# Altium project BA_Leo_Maier_DiffProbes.PrjPcb
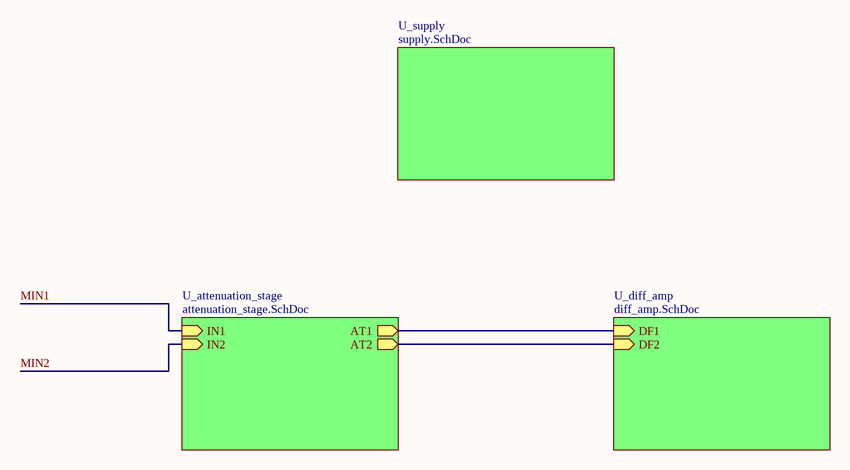
[diagram p0: diff_probe.SchDoc]
4 sheets, 60 parts. Net scope: hierarchical (ports join the sheet entries above them; power ports are global).
Board files: diff_probe_v2.PcbDoc, diff_probe.PcbDoc
Sheets:
  diff_probe.SchDoc
    U_diff_amp = diff_amp.SchDoc
    U_supply = supply.SchDoc
    U_attenuation_stage = attenuation_stage.SchDoc

## Sheet diff_probe.SchDoc
size A4; CompanyName: MCI Management Center Innsbruck; Address1: Universitätsstraße 15; Address2: A-6020 Innsbruck

### Sub-sheets
U_attenuation_stage = attenuation_stage.SchDoc: AT1 (out), AT2 (out), IN1 (in), IN2 (in)
U_diff_amp = diff_amp.SchDoc: DF1 (in), DF2 (in)
U_supply = supply.SchDoc: no entries

### Nets
NetR21_1: sheet U_diff_amp/DF1, sheet U_attenuation_stage/AT1
NetR23_1: sheet U_diff_amp/DF2, sheet U_attenuation_stage/AT2

### Notes on the sheet
- Size:
- Mechatronics - Electrical Engineering
- Project:
- A4
- Title:
- Date:
- Revision:
- Sheet:
- of
- File:
- Author:

## Sheet diff_amp.SchDoc
size A4; CompanyName: MCI Management Center Innsbruck; Address1: Universitätsstraße 15; Address2: A-6020 Innsbruck
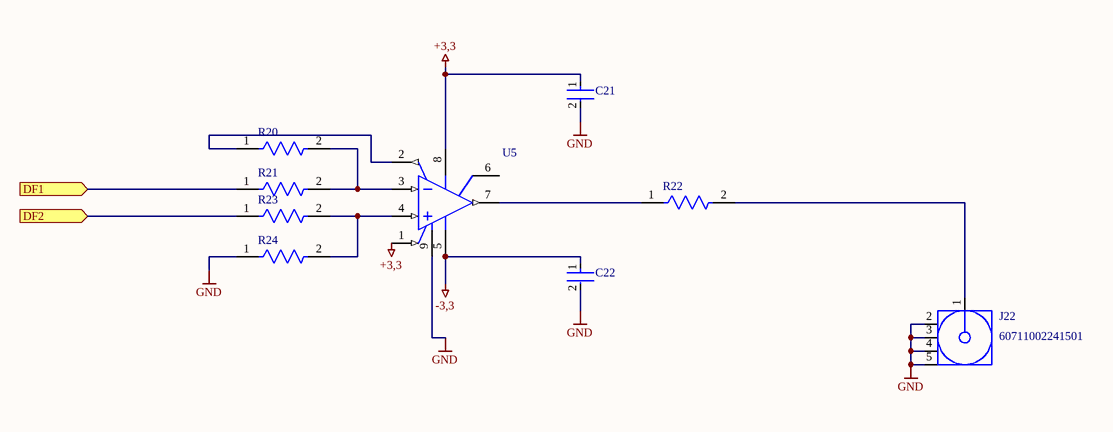
[diagram p1: diff_amp.SchDoc]

### Parts
C21  CGA2B3X7R1E104K050BB  [FP-CGA2B-IPC_B]  (value not drawn)
C22  CGA2B3X7R1E104K050BB  [FP-CGA2B-IPC_B]  (value not drawn)
J22  60711002241501  [60711002241501]
R20  RG1005N-4020-W-T5  [FP-RG1005-IPC_B]  (value not drawn)
R21  RG1005N-4020-W-T5  [FP-RG1005-IPC_B]  (value not drawn)
R22  RT0603BRE0749R9L  [FP-RT0603-MFG]  (value not drawn)
R23  RG1005N-4020-W-T5  [FP-RG1005-IPC_B]  (value not drawn)
R24  RG1005N-4020-W-T5  [FP-RG1005-IPC_B]  (value not drawn)
U5  ADA4817-1ACPZ-R7  [ADI-CP-8-2_L]  (value not drawn)

### Ports
DF1 (in), DF2 (in)

### Nets
+3,3: C21.1 U5.1(~{PD}) U5.8(+VS)
-3,3: C22.1 U5.5(-VS)
GND: C21.2 C22.2 J22.2(GND) J22.3(GND) J22.4(GND) J22.5(GND) R24.1 U5.9(EP)
NetJ22_1: J22.1(Signal) R22.2
NetR20_1: R20.1 U5.2(FB)
NetR20_2: R20.2 R21.2 U5.3(-IN)
NetR21_1: R21.1 ; port DF1
NetR22_1: R22.1 U5.7(OUT)
NetR23_1: R23.1 ; port DF2
NetR23_2: R23.2 R24.2 U5.4(+IN)

Not connected (* = marked no-connect by the designer): U5 6(NC)

### Notes on the sheet
- Size:
- Mechatronics - Electrical Engineering
- Project:
- A4
- Title:
- Date:
- Revision:
- Sheet:
- of
- File:
- Author:

### Library data of the parts
C21 C22 = CMP-2000-06086-2: Cap Ceramic 100nF 25V X7R 10% Pad SMD 0402 +125°C Automotive T/R; Lead Free: Lead Free; Termination: SMD/SMT; Voltage Rating: 25V; Voltage: 25V; Composition: Ceramic; Case/Package: 0402; Mount: Surface Mount; Voltage Rating (DC): 25V; Tolerance: 10%; Length: 1mm; Width: 0.02inch; REACH SVHC: No SVHC; Max Operating Temperature: 125°C; Case Code (Metric): 1005; Case Code (Imperial): 0402; Package Quantity: 1; Depth: 0.5mm; Min Operating Temperature: -55°C; Thickness: 0.022inch; Capacitance: 100nF; Height: 0.5mm; Dielectric: X7R; Packaging: Tape and Reel; Weight: 2.3E-05oz; Ratings: AEC-Q200
J22 = CMP-03913-154947495-1: Rf Coax Conn, Smc R/a Jack, 50 Ohm, Pcb Rohs Compliant: Yes
R20 R21 R23 R24 = CMP-28537-013757-1: Automotive Metal Thin Film Chip Resistor, 0402, 402Ω, 0.05%, 10ppm/°C, 0.0625W, 75V; Voltage Rating (DC): 25V; Resistance: 402R; Power Rating: 30mW; Max Power Dissipation: 63mW; Package Quantity: 5000; Case/Package: 0402; Max Operating Temperature: 155°C; Case Code (Imperial): 0402; Height: 0.016inch; Voltage Rating: 25V; Min Operating Temperature: -55°C; Temperature Coefficient: 10ppm/°C; Length: 0.039inch; Features: Automotive AEC-Q200; Width: 0.5mm; Series: RG; RoHS Compliant: Yes; Resistor Type: Thin Film; Packaging: Tape and Reel; Tolerance: 0.05%; Lead Free: Lead Free; Case Code (Metric): 1005; Number of Terminations: 2; Termination: SMD/SMT
R22 = CMP-2000-04544-2: RES SMD 49.9 OHM 0.1% 1/10W 0603; Manufacturer: Yageo; Temperature Coefficient: 50 ppm/°C; Tolerance: 0.001; Voltage Rating: 75V; Power Rating: 0.1W; Resistance: 49.9Ω; Value: 49.9Ω; ComponentLink2URL: http://www.yageo.com/documents/recent/PYu-RT_1-to-0.01_RoHS_L_9.pdf; Composition: Thin Film; Category: Res; Manufacturer Part Number: RT0603BRE0749R9L; Digikey Description: RES SMD 49.9 OHM 0.1% 1/10W 0603; RoHS: TRUE; Temperature Range Low: -55°C; Device Class L3: Chip SMD Resistors; Package: RT0603; Automotive: No; Temperature Range High: +155°C; Height: 0.55mm; Device Class L2: Resistors; Mouser Description: RT Series 0603 0.1 W 49.9 kOhm ±0.1 % ±50 ppm/°C SMT Thin Film Chip Resistor; Lead Free: Yes; Series: RT; Octopart: https://octopart.com/rt0603bre0749r9l-yageo-1456229; ComponentLink2Description: Datasheet; Footprint Url: http://www.yageo.com/exep/pages/download/literatures/PYu-R_Mount_10.pdf; Device Class L1: Passive Components; Temperature: -55°C to +155°C; Ipc Land Pattern Name: RESC16080X45
U5 = CMP-0384-00096-1: Single Channel Low Noise Operational Amplifier, 1.05 GHz BW, 870 V/us SR, Industrial, 8-pin QFN (CP-8-2), Reel; Manufacturer: Analog Devices; Iq/Amp: 21mA; Input Bias Current: 2pA; Amplifiers Per Package: 1; V Span Max: 10V; Input Offset Voltage: 2mV; V Span Min: 5V; DatasheetVersion: Rev. A; ComponentLink2URL: http://www.analog.com/static/imported-files/data_sheets/ADA4817-1_4817-2.pdf; ComponentLink1Description: Manufacturer URL; ComponentLink1URL: http://www.analog.com/en/index.html; PartNumber: ADA4817-1ACPZ-R7; PackageVersion: 061507-B; ComponentLink3URL: http://www.analog.com/static/imported-files/packages/56953322593982CP_8_2.pdf; Slew Rate: 870V/us; ComponentLink2Description: Datasheet; Generic Part Number: ADA4817-1; PackageReference: CP-8-2; Small Signal Bandwidth: 1.05GHz; Mounting Technology: Surface Mount; ComponentLink3Description: Package Specification; PackageDescription: 8-Pin Lead Frame Chip Scale Package, Body 3 x 3 mm, Pitch 0.5 mm

## Sheet supply.SchDoc
size A4; CompanyName: MCI Management Center Innsbruck; Address1: Universitätsstraße 15; Address2: A-6020 Innsbruck
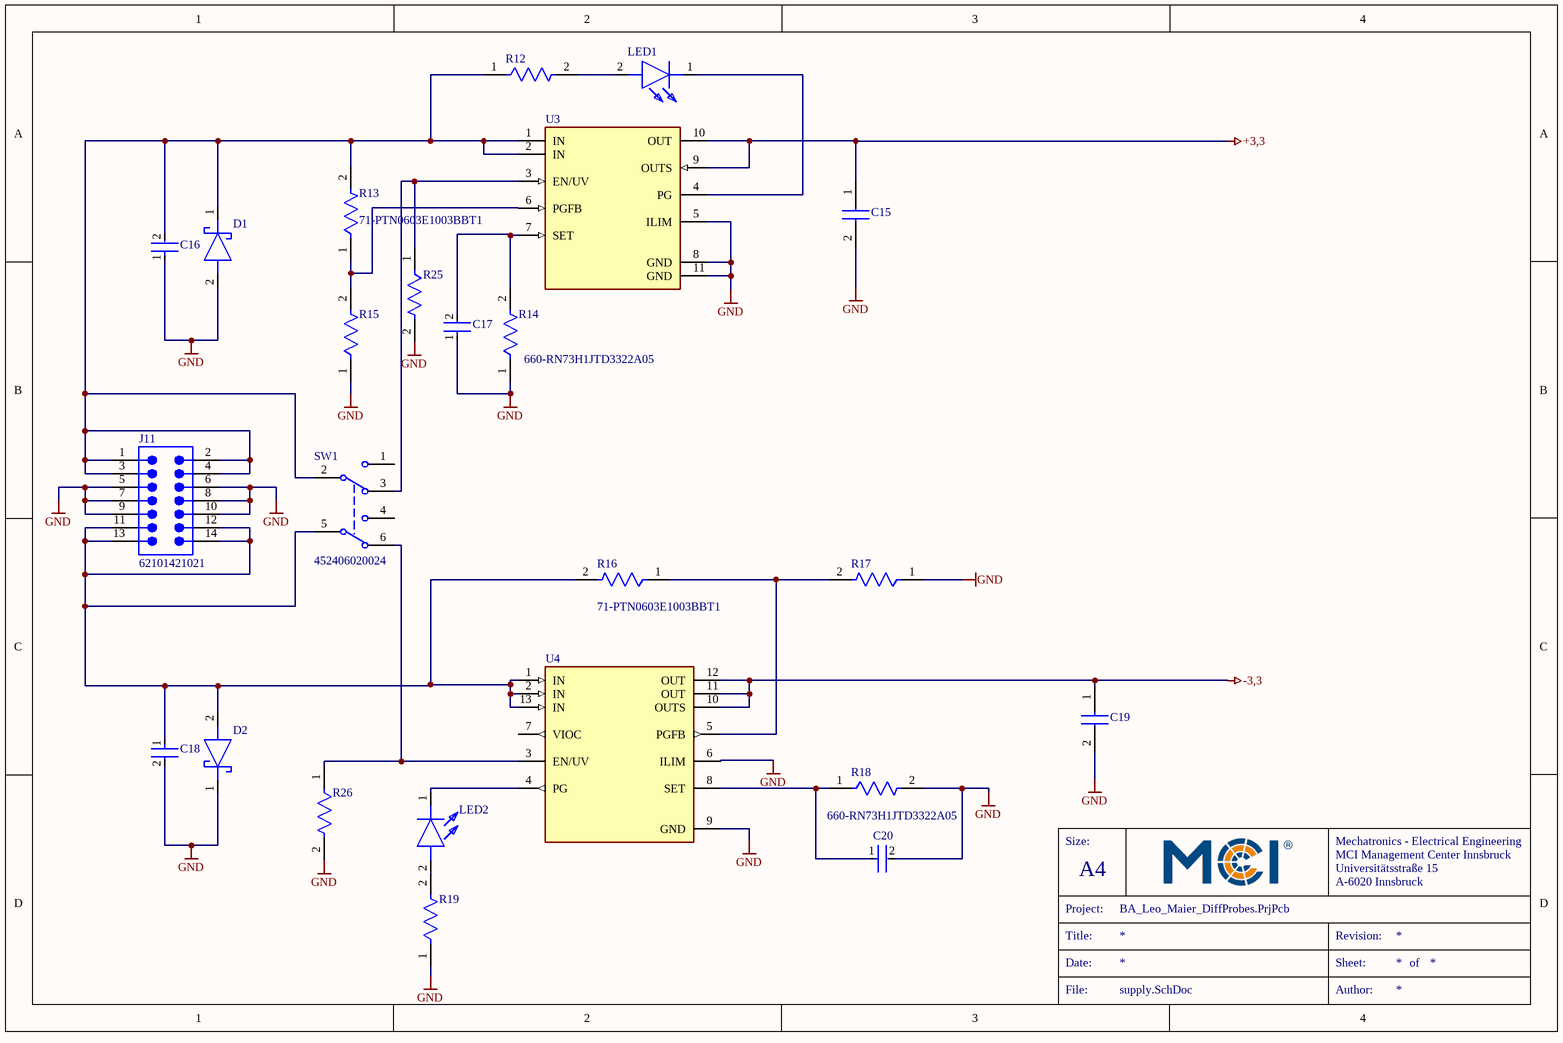
[diagram p2: supply.SchDoc]

### Parts
C15  MCASE31LBB7226MTNA01  [CAPC3214X190N]  (value not drawn)
C16  CGA4J1X7R1E475K125AE  [FP-CGA4J-IPC_A]  (value not drawn)
C17  CGA4J1X7R1E475K125AE  [FP-CGA4J-IPC_A]  (value not drawn)
C18  CGA4J1X7R1E475K125AE  [FP-CGA4J-IPC_A]  (value not drawn)
C19  MCASE31LBB7226MTNA01  [CAPC3214X190N]  (value not drawn)
C20  CGA4J1X7R1E475K125AE  [FP-CGA4J-IPC_A]  (value not drawn)
D1  RB521S-30  [SODFL1608X77N]  (value not drawn)
D2  RB521S-30  [SODFL1608X77N]  (value not drawn)
J11  62101421021  [62101421021]
LED1  APT1608SEC_J3-AMT  [APT1608SECJ3AMT]  (value not drawn)
LED2  APT1608SEC_J3-AMT  [APT1608SECJ3AMT]  (value not drawn)
R12  AC0402FR-7W1K2L  [FP-AC0402-IPC_A]  (value not drawn)
R13  Mouser Part Number: 71-PTN0603E1003BBT1  [FP-RT0603-MFG]  (hidden comment: RT0603BRE07100KL)
R14  Mouser Part Number: 660-RN73H1JTD3322A05  [FP-AT0603-IPC_B]  (hidden comment: AT0603FRE0733K2L)
R15  RT0603BRD1310KL  [FP-RT0603-MFG]  (value not drawn)
R16  Mouser Part Number: 71-PTN0603E1003BBT1  [FP-RT0603-MFG]  (hidden comment: RT0603BRE07100KL)
R17  RT0603BRD1310KL  [FP-RT0603-MFG]  (value not drawn)
R18  Mouser Part Number: 660-RN73H1JTD3322A05  [FP-AT0603-IPC_B]  (hidden comment: AT0603FRE0733K2L)
R19  AC0402FR-7W1K2L  [FP-AC0402-IPC_A]  (value not drawn)
R25  RT0603BRE07100KL  [FP-RT0603-MFG]  (value not drawn)
R26  RT0603BRE07100KL  [FP-RT0603-MFG]  (value not drawn)
SW1  452406020024  [452406020024]
U3  LT3045EDD#PBF  [FP-LT3045EDD#PBF-MFG]  (value not drawn)
U4  LT3094EDD#PBF  [FP-DD-12-05-08-1725-IPC_B]  (value not drawn)

### Nets
+3,3: C15.1 U3.9(OUTS) U3.10(OUT)
-3,3: C19.1 U4.10(OUTS) U4.11(OUT) U4.12(OUT)
GND: C15.2 C16.1 C17.1 C18.2 C19.2 C20.2 D1.2(A) D2.1(K) J11.5 J11.6 J11.7 J11.8 J11.9 J11.10 R14.1 R15.1 R17.1 R18.2 R19.1 R25.2 R26.2 U3.5(ILIM) U3.8(GND) U3.11(GND) U4.6(ILIM) U4.9(GND)
NetC16_2: C16.2 D1.1(K) J11.1 J11.2 J11.3 J11.4 R12.1 R13.2 SW1.2(COM) U3.1(IN) U3.2(IN)
NetC17_2: C17.2 R14.2 U3.7(SET)
NetC18_1: C18.1 D2.2(A) J11.11 J11.12 J11.13 J11.14 R16.2 SW1.5(COM) U4.1(IN) U4.2(IN) U4.13(IN)
NetC20_1: C20.1 R18.1 U4.8(SET)
NetLED1_1: LED1.1(K) U3.4(PG)
NetLED1_2: LED1.2(A) R12.2
NetLED2_1: LED2.1(K) U4.4(PG)
NetLED2_2: LED2.2(A) R19.2
NetR13_1: R13.1 R15.2 U3.6(PGFB)
NetR16_1: R16.1 R17.2 U4.5(PGFB)
NetR25_1: R25.1 SW1.3 U3.3(EN/UV)
NetR26_1: R26.1 SW1.6 U4.3(EN/UV)

Not connected (* = marked no-connect by the designer): SW1 1 4; U4 7(VIOC)

### Notes on the sheet
- Size:
- Mechatronics - Electrical Engineering
- Project:
- A4
- Title:
- Date:
- Revision:
- Sheet:
- of
- File:
- Author:

### Library data of the parts
C15 C19 = MCASE31LBB7226MTNA01: Capacitor; Manufacturer_Name: TAIYO YUDEN; Datasheet Link: https://www.mouser.in/datasheet/3/940/1/c_mlcc_C_e.pdf; Height: 1.9mm; Manufacturer_Part_Number: MCASE31LBB7226MTNA01
C16-C18 C20 = CMP-08246-002248-1: Cap Ceramic 4.7uF 25V X7R 10% Pad SMD 0805 +125°C Automotive T/R; Thickness: 0.059inch; Length: 0.079inch; Voltage Rating: 25V; Case Code (Metric): 2012; Min Operating Temperature: -55°C; Capacitance: 4.7uF; Mount: Surface Mount; Ratings: AEC-Q200; Packaging: Tape and Reel; Features: Soft Termination; Width: 0.047inch; Max Operating Temperature: 125°C; Tolerance: 10%; Case/Package: 0805; Case Code (Imperial): 0805
  C16: Parameter 1: *
D1 D2 = RB521S-30: Schottky Diode; Manufacturer_Name: Comchip Technology; Datasheet Link: https://www.mouser.in/datasheet/3/819/1/RB521S_30_RevC543202.pdf; Height: 0.77mm; Manufacturer_Part_Number: RB521S-30; Mouser Part Number: 750-RB521S-30; Mouser Price/Stock: https://www.mouser.co.uk/ProductDetail/Comchip-Technology/RB521S-30?qs=2qJf6qQ4IOKtVSsHa5L7cw%3D%3D
J11 = CMP-1502-00928-4: Conn, Header, 14Pos, 2Row, 1.27Mm Rohs Compliant: Yes; Contact Resistance: 20mΩ; Gender: Male; Current Rating: 1A; Operating Supply Voltage: 100V; Orientation: Vertical; RoHS: Non-Compliant; Lead Pitch: 1.27mm; Number of Pins: 14
LED1 LED2 = APT1608SEC_J3-AMT: LED; Manufacturer_Name: Kingbright; Manufacturer_Part_Number: APT1608SEC/J3-AMT; Datasheet Link: https://www.kingbrightusa.com/images/catalog/SPEC/APT1608SEC-J3-AMT.pdf; Height: 0.85mm; Mouser Part Number: 604-APT1608SEC/J3AMT; Mouser Price/Stock: https://www.mouser.co.uk/ProductDetail/Kingbright/APT1608SEC-J3-AMT?qs=0pUdBCiL%2F4PrQrm2zkbL8w%3D%3D; Arrow Part Number: APT1608SEC/J3-AMT; Arrow Price/Stock: https://www.arrow.com/en/products/apt1608secj3-amt/kingbright?utm_currency=USD&region=nac
R12 R19 = CMP-03412-048489-1: RES 1.2kΩ ±1% 0.125W 0402
R13 R16 R25 R26 = CMP-2000-04515-2: RES SMD 100K OHM 0.1% 1/10W 0603; Manufacturer: Yageo; Tolerance: 0.001; Voltage Rating: 75V; Resistance: 100KΩ; Temperature Coefficient: 50 ppm/°C; Value: 100KΩ; Power Rating: 0.1W; Device Class L1: Passive Components; Category: Res; Ipc Land Pattern Name: RESC16080X45; Footprint Url: http://www.yageo.com/exep/pages/download/literatures/PYu-R_Mount_10.pdf; Temperature Range Low: -55°C; Package: RT0603; Automotive: No; ComponentLink2URL: http://www.yageo.com/documents/recent/PYu-RT_1-to-0.01_RoHS_L_9.pdf; Composition: Thin Film; Manufacturer Part Number: RT0603BRE07100KL; Temperature Range High: +155°C; Octopart: https://octopart.com/rt0603bre07100kl-yageo-1377021; RoHS: TRUE; Series: RT; ComponentLink2Description: Datasheet; Device Class L2: Resistors; Device Class L3: Chip SMD Resistors; Lead Free: Yes; Digikey Description: RES SMD 100K OHM 0.1% 1/10W 0603; Temperature: -55°C to +155°C; Height: 0.55mm
R14 R18 = CMP-03412-041587-1: Thin Film Chip Resistors Automotive Grade 33.2kΩ 1% 50ppm/°C 0603; RoHS Compliant: Yes
R15 R17 = CMP-03412-009757-1: RT0603 10KΩ 0.1W 25 ppm/°C 0.10%; Manufacturer: Yageo; Voltage Rating: 75V; Tolerance: 0.001; Resistance: 10KΩ; Manufacturer Part Number: RT0603BRD1310KL; Category: Res; Device Class L2: Resistors; Lead Free: Yes; Footprint Url: http://www.yageo.com/exep/pages/download/literatures/PYu-R_Mount_10.pdf; Ipc Land Pattern Name: RESC16080X45; Octopart: https://octopart.com/rt0603brd1310kl-yageo-30512336; Composition: Thin Film; Temperature Coefficient: 25 ppm/°C; ComponentLink2Description: Datasheet; Temperature Range Low: -55°C; Temperature Range High: +155°C; Value: 10KΩ; Device Class L1: Passive Components; Package: RT0603; Power Rating: 0.1W; Automotive: No; ComponentLink2URL: http://www.yageo.com/documents/recent/PYu-RT_1-to-0.01_RoHS_L_9.pdf; Mouser Description: Res Thin Film 0603 10K Ohm 0.1% 1/10W ±25ppm/°C Molded SMD Paper T/R; Device Class L3: Chip SMD Resistors; Temperature: -55°C to +155°C; Height: 0.55mm; RoHS: TRUE; Series: RT
SW1 = CMP-03913-146831046-2: WS-SLSV Mini Slide Switch; Manufacturer Lifecycle Status: ACTIVE; Insulation Resistance: 100MΩ; YEOL: 1 = Estimated lifetime > 10 years; Max Operating Temperature: 85°C; RoHS: Compliant; Min Operating Temperature: -40°C; Contact Plating: Silver; Lifecycle Status: Production
U3 = CMP-09138-000240-1: IC REG LINEAR 0V 500MA 10DFN; Min Current Limit: 570mA; Number of Regulators: 1; Dropout Voltage: 260mV; Output Voltage: 15V; RoHS Compliant: Yes; Series: -; Output Current: 500mA; Case/Package: DFN; Max Operating Temperature: 125°C; Min Operating Temperature: -40°C
U4 = CMP-09138-000084-1: IC REG LIN NEG ADJ 500MA 12DFN; RoHS Compliant: Yes

## Sheet attenuation_stage.SchDoc
size A4; CompanyName: MCI Management Center Innsbruck; Address1: Universitätsstraße 15; Address2: A-6020 Innsbruck
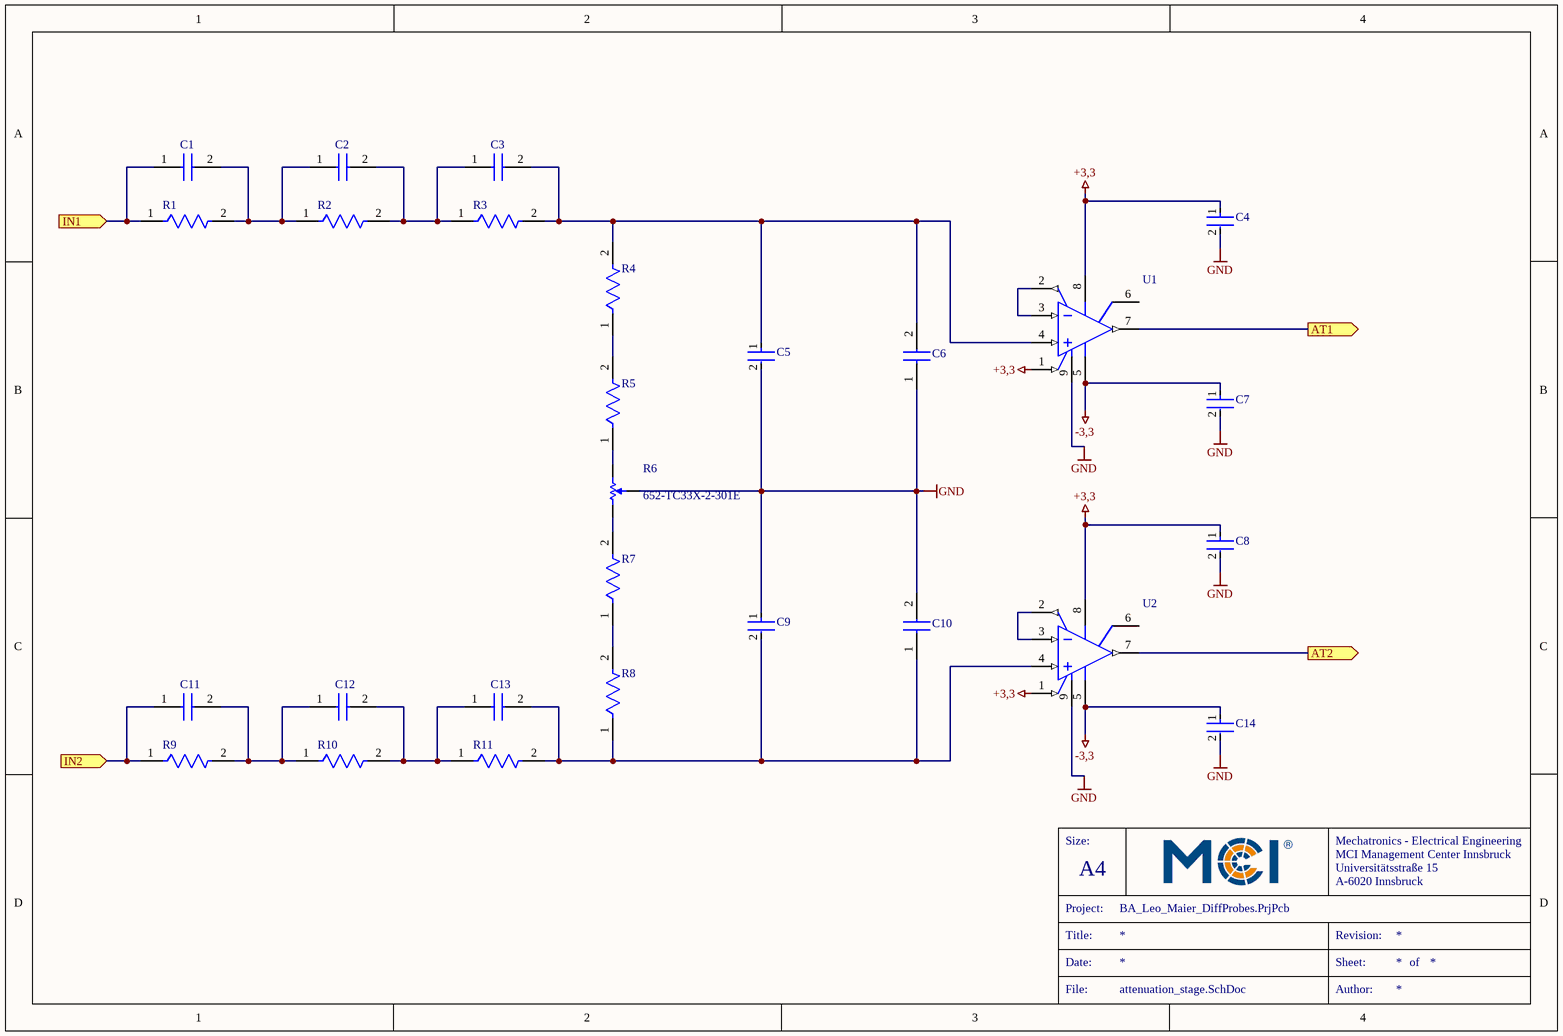
[diagram p3: attenuation_stage.SchDoc]

### Parts
C1  C0402C100C5GACAUTO  [CAPC1005X65N]  (value not drawn)
C2  C0402C100C5GACAUTO  [CAPC1005X65N]  (value not drawn)
C3  C0402C100C5GACAUTO  [CAPC1005X65N]  (value not drawn)
C4  CGA2B3X7R1E104K050BB  [FP-CGA2B-IPC_B]  (value not drawn)
C5  GRT1555C1H511FA02D  [FP-GRT155-0_05-IPC_A]  (value not drawn)
C6  JR200  [CAPM3531X35N]  (value not drawn)
C7  CGA2B3X7R1E104K050BB  [FP-CGA2B-IPC_B]  (value not drawn)
C8  CGA2B3X7R1E104K050BB  [FP-CGA2B-IPC_B]  (value not drawn)
C9  GRT1555C1H511FA02D  [FP-GRT155-0_05-IPC_A]  (value not drawn)
C10  JR200  [CAPM3531X35N]  (value not drawn)
C11  C0402C100C5GACAUTO  [CAPC1005X65N]  (value not drawn)
C12  C0402C100C5GACAUTO  [CAPC1005X65N]  (value not drawn)
C13  C0402C100C5GACAUTO  [CAPC1005X65N]  (value not drawn)
C14  CGA2B3X7R1E104K050BB  [FP-CGA2B-IPC_B]  (value not drawn)
R1  ERA-3AEB334V  [FP-ERA3A-MFG]  (value not drawn)
R2  ERA-3AEB334V  [FP-ERA3A-MFG]  (value not drawn)
R3  ERA-3AEB334V  [FP-ERA3A-MFG]  (value not drawn)
R4  RT0603BRD076K49L  [FP-RT0603-MFG]  (value not drawn)
R5  RT0603BRD0721R5L  [FP-RT0603-MFG]  (value not drawn)
R6  Mouser Part Number: 652-TC33X-2-301E  [BOUR-TC33X-2_V]  (hidden comment: TC33X-2-103E)
R7  RT0603BRD0721R5L  [FP-RT0603-MFG]  (value not drawn)
R8  RT0603BRD076K49L  [FP-RT0603-MFG]  (value not drawn)
R9  ERA-3AEB334V  [FP-ERA3A-MFG]  (value not drawn)
R10  ERA-3AEB334V  [FP-ERA3A-MFG]  (value not drawn)
R11  ERA-3AEB334V  [FP-ERA3A-MFG]  (value not drawn)
U1  ADA4817-1ACPZ-R7  [ADI-CP-8-2_L]  (value not drawn)
U2  ADA4817-1ACPZ-R7  [ADI-CP-8-2_L]  (value not drawn)

### Ports
AT1 (out), AT2 (out), IN1 (in), IN2 (in)

### Nets
+3,3: C4.1 C8.1 U1.1(~{PD}) U1.8(+VS) U2.1(~{PD}) U2.8(+VS)
-3,3: C7.1 C14.1 U1.5(-VS) U2.5(-VS)
GND: C4.2 C5.2 C6.1 C7.2 C8.2 C9.1 C10.2 C14.2 R6.2 U1.9(EP) U2.9(EP)
MIN1: C1.1 R1.1 ; port IN1
MIN2: C11.1 R9.1 ; port IN2
NetC1_2: C1.2 C2.1 R1.2 R2.1
NetC2_2: C2.2 C3.1 R2.2 R3.1
NetC3_2: C3.2 C5.1 C6.2 R3.2 R4.2 U1.4(+IN)
NetC9_2: C9.2 C10.1 C13.2 R8.1 R11.2 U2.4(+IN)
NetC11_2: C11.2 C12.1 R9.2 R10.1
NetC12_2: C12.2 C13.1 R10.2 R11.1
NetR4_1: R4.1 R5.2
NetR5_1: R5.1 R6.3
NetR6_1: R6.1 R7.2
NetR7_1: R7.1 R8.2
NetR21_1: U1.7(OUT) ; port AT1
NetR23_1: U2.7(OUT) ; port AT2
NetU1_2: U1.2(FB) U1.3(-IN)
NetU2_2: U2.2(FB) U2.3(-IN)

Not connected (* = marked no-connect by the designer): U1 6(NC); U2 6(NC)

### Notes on the sheet
- Size:
- Mechatronics - Electrical Engineering
- Project:
- A4
- Title:
- Date:
- Revision:
- Sheet:
- of
- File:
- Author:

### Library data of the parts
C1-C3 C11-C13 = C0402C100C5GACAUTO: Capacitor; Manufacturer_Name: Yageo Group; Datasheet Link: https://www.arrow.com/en/products/c0402c100c5gacauto/kemet-corporation?region=nac; Height: 0.65mm; Manufacturer_Part_Number: C0402C100C5GACAUTO; Mouser Part Number: 80-C0402C100C5GAUTO; Mouser Price/Stock: https://www.mouser.co.uk/ProductDetail/KEMET/C0402C100C5GACAUTO?qs=jI8Gez59nxIdSgXSmqmKxg%3D%3D; Arrow Part Number: C0402C100C5GACAUTO; Arrow Price/Stock: https://www.arrow.com/en/products/c0402c100c5gacauto/kemet-corporation?region=nac
C4 C7 C8 C14 = CMP-2000-06086-2: as C21 on sheet diff_amp; Lead Free: Lead Free; Termination: SMD/SMT; Voltage Rating: 25V; Voltage: 25V; Composition: Ceramic; Case/Package: 0402; Mount: Surface Mount; Voltage Rating (DC): 25V; Tolerance: 10%; Length: 1mm; Width: 0.02inch; REACH SVHC: No SVHC; Max Operating Temperature: 125°C; Case Code (Metric): 1005; Case Code (Imperial): 0402; Package Quantity: 1; Depth: 0.5mm; Min Operating Temperature: -55°C; Thickness: 0.022inch; Capacitance: 100nF; Height: 0.5mm; Dielectric: X7R; Packaging: Tape and Reel; Weight: 2.3E-05oz; Ratings: AEC-Q200
C5 C9 = CMP-06035-032859-1: Multi-Layer Ceramic Capacitor 510pF 50V C0G ±1% 0402 Paper T/R
C6 C10 = JR200: Capacitor; Manufacturer_Name: Knowles; Datasheet Link: https://datasheet.datasheetarchive.com/originals/distributors/DKDS-39/7593.pdf; Height: 0.35mm; Manufacturer_Part_Number: JR200; Mouser Part Number: 768-JR200; Mouser Price/Stock: https://www.mouser.co.uk/ProductDetail/Knowles-Voltronics/JR200?qs=Xqu1B%2Fs4UobrJFNnt%2FmsIw%3D%3D
R1-R3 R9-R11 = CMP-2000-00042-2: NexarPartId: 1240193; Max Power Dissipation: 100mW; Temperature Coefficient: 25ppm/°C; Voltage Rating (DC): 75V; Resistance: 330kΩ; Tolerance: 0.1%; Depth: 800µm; Composition: Metal Film, Thin Film; Termination: SMD/SMT; RoHS: Compliant; Case Code (Metric): 1608; Length: 1.6mm; Features: Automotive AEC-Q200; Number of Terminations: 2; Military Standard: Not; Min Operating Temperature: -55°C; Power Rating: 100mW; REACH SVHC: No SVHC; Mount: Surface Mount; Voltage Rating: 75V; Lifecycle Status: Production; Case/Package: 0603; Case Code (Imperial): 0603; Schedule B: 8533210045, 8533210045; Lead Free: Lead Free; Packaging: Tape & Reel; Radiation Hardening: No; Contact Plating: Tin; Height: 450µm; Max Operating Temperature: 155°C; Width: 800µm; Number of Pins: 2
R4 R8 = CMP-2000-04494-2: RES 6.49K OHM 1/10W .1% SMD 0603; Manufacturer: Yageo; Temperature Coefficient: 25 ppm/°C; Tolerance: 0.001; Value: 6.49KΩ; Power Rating: 0.1W; Voltage Rating: 75V; Device Class L3: Chip SMD Resistors; Mouser Description: Thin Film Resistors - SMD 1/10W 6.49K ohm .1% 25ppm; Ipc Land Pattern Name: RESC16080X45; ComponentLink2URL: http://www.yageo.com/documents/recent/PYu-RT_1-to-0.01_RoHS_L_9.pdf; Device Class L1: Passive Components; Footprint Url: http://www.yageo.com/exep/pages/download/literatures/PYu-R_Mount_10.pdf; Category: Res; Device Class L2: Resistors; Temperature: -55°C to +155°C; Automotive: No; Digikey Description: RES 6.49K OHM 1/10W .1% SMD 0603; Temperature Range High: +155°C; RoHS: TRUE; Manufacturer Part Number: RT0603BRD076K49L; Height: 0.55mm; Package: RT0603; Lead Free: Yes; ComponentLink2Description: Datasheet; Composition: Thin Film; Octopart: https://octopart.com/rt0603brd076k49l-yageo-1437223; Resistance: 6.49KΩ; Temperature Range Low: -55°C; Series: RT
R5 R7 = CMP-03412-004607-1: RES SMD 21.5 OHM 0.1% 1/10W 0603; Manufacturer: Yageo; Temperature Coefficient: 25 ppm/°C; Value: 21.5Ω; Voltage Rating: 75V; Power Rating: 0.1W; Tolerance: 0.001; Temperature Range High: +155°C; Footprint Url: http://www.yageo.com/exep/pages/download/literatures/PYu-R_Mount_10.pdf; Device Class L2: Resistors; Lead Free: Yes; Temperature: -55°C to +155°C; Composition: Thin Film; Manufacturer Part Number: RT0603BRD0721R5L; ComponentLink2Description: Datasheet; Series: RT; Device Class L1: Passive Components; Temperature Range Low: -55°C; Mouser Description: Thin Film Resistors - SMD 1/10W 21.5 ohm .1% 25ppm; Automotive: No; Digikey Description: RES SMD 21.5 OHM 0.1% 1/10W 0603; Package: RT0603; ComponentLink2URL: http://www.yageo.com/documents/recent/PYu-RT_1-to-0.01_RoHS_L_9.pdf; RoHS: TRUE; Resistance: 21.5Ω; Ipc Land Pattern Name: RESC16080X45; Octopart: https://octopart.com/rt0603brd0721r5l-yageo-1419580; Category: Res; Height: 0.55mm; Device Class L3: Chip SMD Resistors
R6 = CMP-2100-03695-1: Trimming Potentiometer, 10000 Ohm, -40 to 100 degC, 3-Pin SMD, RoHS, Tape and Reel; Manufacturer: Bourns; Tolerance: 25%; Max Power Dissipation: 100mW; Number of Turns: 1; Resistance: 10KOhm; Temperature Coefficient: 250ppm/degreesC; Voltage Rating (DC): 50V; Datasheet URL: http://www.bourns.com/docs/Product-Datasheets/TC33.pdf; Composition: Potentiometer; Package Description: 3-Pin Surface Mount Device, Body 3.8 x 3.6 mm; Weight: 29.4mg; Power Rating: 100mW; Termination: FootPrint; Manufacturer URL: http://www.bourns.com/; Width: 0.118inch; Height: 0.047inch; Military Standard: Not; Radiation Hardening: No; Colour: Silver; Case/Package: SMD/SMT; Depth: 3.8mm; Min Operating Temperature: -40degC; Lead Free: LeadFree; Datasheet Version: 42583.0; REACH SVHC: NoSVHC; Length: 3mm; RoHSCompliant: true; Contact Plating: Silver; Taper: Linear; Packaging: TapeandReel; Mount: SurfaceMount; Max Operating Temperature: 100degC; Package Reference: TC33X-2; Package Quantity: 2500; Mouser Nr: 652-TC33X-2-301E
U1 U2 = CMP-0384-00096-1: as U5 on sheet diff_amp; DatasheetVersion: Rev. A; ComponentLink2URL: http://www.analog.com/static/imported-files/data_sheets/ADA4817-1_4817-2.pdf; ComponentLink1Description: Manufacturer URL; ComponentLink1URL: http://www.analog.com/en/index.html; PartNumber: ADA4817-1ACPZ-R7; PackageVersion: 061507-B; ComponentLink3URL: http://www.analog.com/static/imported-files/packages/56953322593982CP_8_2.pdf; Slew Rate: 870V/us; ComponentLink2Description: Datasheet; Generic Part Number: ADA4817-1; PackageReference: CP-8-2; Small Signal Bandwidth: 1.05GHz; Mounting Technology: Surface Mount; ComponentLink3Description: Package Specification; PackageDescription: 8-Pin Lead Frame Chip Scale Package, Body 3 x 3 mm, Pitch 0.5 mm

## Nets that join several sheets
+3,3: diff_amp (C21.1 U5.1 U5.8), supply (C15.1 U3.9 U3.10), attenuation_stage (6 pins)
-3,3: diff_amp (C22.1 U5.5), supply (C19.1 U4.10 U4.11 U4.12), attenuation_stage (C7.1 C14.1 U1.5 U2.5)
GND: diff_amp (8 pins), supply (26 pins), attenuation_stage (11 pins)
NetR21_1: diff_amp (R21.1), attenuation_stage (U1.7)
NetR23_1: diff_amp (R23.1), attenuation_stage (U2.7)